# Altium project Relay-10A-Switching-Board-v2.0.PrjPcb (part 2 of 3)

## Sheet Controller-Sheet.SchDoc
size 420 x 297 mm; SheetNumber: 4; SheetTotal: 5
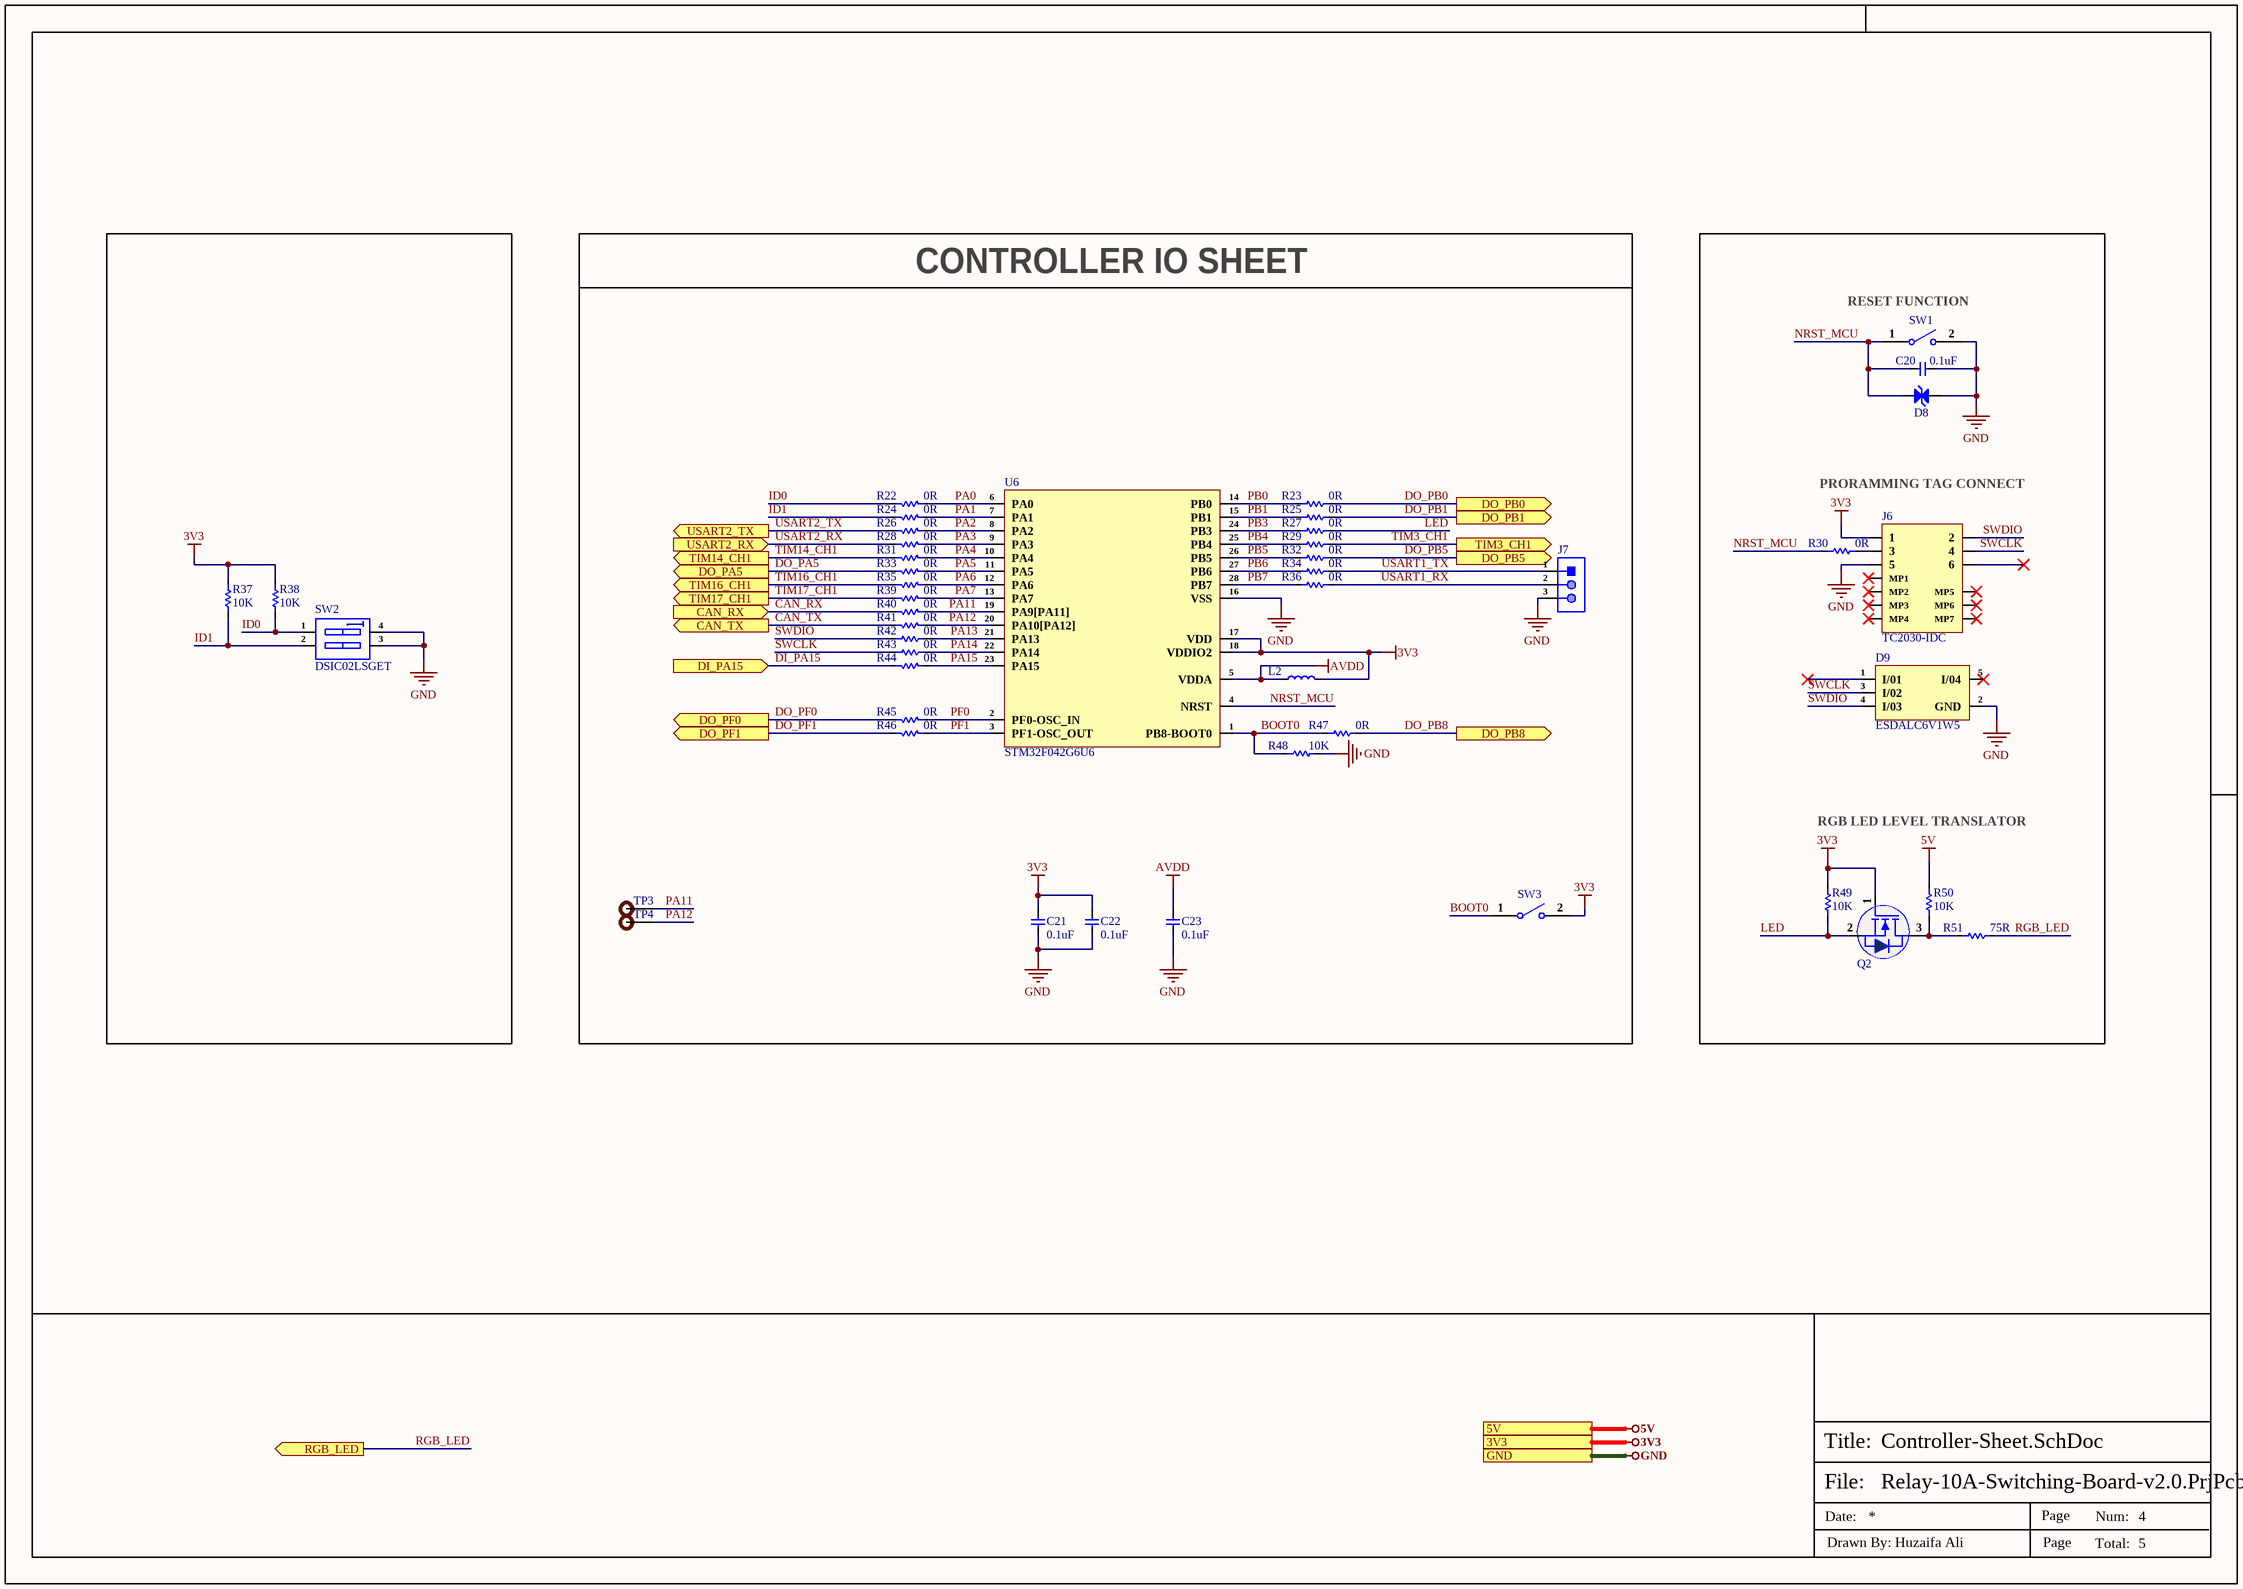
[diagram p2: Controller-Sheet.SchDoc]

### Parts
C20  0.1uF  [Cap-0402]
C21  0.1uF  [Cap-0402]
C22  0.1uF  [Cap-0402]
C23  0.1uF  [Cap-0402]
D8  ESDM2033MX4T5G  [DFN-2(0.3x0.6)]  (value not drawn)
D9  ESDALC6V1W5  [SOT-323-5]
J6  TC2030-IDC  [TC2030-IDC_]
J7  X6511WV-03H-C60D30  [HDR1X3_]  (value not drawn)
L2  BLM15AG601SN1D  [IND-0402]  (value not drawn)
Q2  Si2302CDS  [Sot-23]  (value not drawn)
R22  0R  [Res-0402]
R23  0R  [Res-0402]
R24  0R  [Res-0402]
R25  0R  [Res-0402]
R26  0R  [Res-0402]
R27  0R  [Res-0402]
R28  0R  [Res-0402]
R29  0R  [Res-0402]
R30  0R  [Res-0402]
R31  0R  [Res-0402]
R32  0R  [Res-0402]
R33  0R  [Res-0402]
R34  0R  [Res-0402]
R35  0R  [Res-0402]
R36  0R  [Res-0402]
R37  10K  [Res-0402]
R38  10K  [Res-0402]
R39  0R  [Res-0402]
R40  0R  [Res-0402]
R41  0R  [Res-0402]
R42  0R  [Res-0402]
R43  0R  [Res-0402]
R44  0R  [Res-0402]
R45  0R  [Res-0402]
R46  0R  [Res-0402]
R47  0R  [Res-0402]
R48  10K  [Res-0402]
R49  10K  [Res-0402]
R50  10K  [Res-0402]
R51  75R  [Res-0402]
SW1  B3U-1000P  [B3U-1000P]  (value not drawn)
SW2  DSIC02LSGET  [DSIC02LSGET]
SW3  B3U-1000P  [B3U-1000P]  (value not drawn)
TP3  TEST POINT  [Test-point]  (value not drawn)  (no BOM)
TP4  TEST POINT  [Test-point]  (value not drawn)  (no BOM)
U6  STM32F042G6U6  [28-UFQFPN (4x4)]

### Blocks framed on the sheet
CONTROLLER IO SHEET: C21-C23 J7 L2 R22-R29 R31-R36 R39-R48 SW3 TP3 TP4 U6

### Ports
3V3 (see Top-Sheet[3B], Comms-Sheet[4D], Power-Sheet[4D], Relay-10-Sheet[4D]), 5V (see Top-Sheet[3B], Comms-Sheet[4D], Power-Sheet[4D]), CAN_RX (in, see Top-Sheet[3B]), CAN_TX (out, see Top-Sheet[3B]), DI_PA15 (in, see Top-Sheet[4B]), DO_PA5 (out, see Top-Sheet[4B]), DO_PB0 (out, see Top-Sheet[4B]), DO_PB1 (out, see Top-Sheet[4B]), DO_PB5 (out, see Top-Sheet[4B]), DO_PB8 (out, see Top-Sheet[3B]), DO_PF0 (out, see Top-Sheet[3B]), DO_PF1 (out, see Top-Sheet[3B]), GND (see Top-Sheet[3B], Comms-Sheet[4D], Power-Sheet[4D], Relay-10-Sheet[4D]), RGB_LED (out, see Top-Sheet[3B]), TIM3_CH1 (out, see Top-Sheet[4B]), TIM14_CH1 (out, see Top-Sheet[4B]), TIM16_CH1 (out, see Top-Sheet[4B]), TIM17_CH1 (out, see Top-Sheet[4B]), USART2_RX (in, see Top-Sheet[3B]), USART2_TX (out, see Top-Sheet[3B])

### Nets
3V3: C21.1 C22.1 J6.1 L2.2 Q2.1(G) R37.2 R38.2 R49.2 SW3.2 U6.17(VDD) U6.18(VDDIO2) ; port 3V3
5V: R50.2 ; port 5V
AVDD: C23.1 L2.1 U6.5(VDDA)
GND: C20.1 C21.2 C22.2 C23.2 D8.1(A) D9.2(GND) J6.5 J7.3 R48.1 SW1.2 SW2.3(A3) SW2.4(B3) U6.16(VSS) ; port GND
BOOT0: R47.2 R48.2 SW3.1 U6.1(PB8-BOOT0)
CAN_RX: R40.1 ; port CAN_RX  [project net CAN1_RXD]
CAN_TX: R41.1 ; port CAN_TX  [project net CAN1_TXD]
DI_PA15: R44.1 ; port DI_PA15
DO_PA5: R33.1 ; port DO_PA5
DO_PB0: R23.1 ; port DO_PB0
DO_PB1: R25.1 ; port DO_PB1
DO_PB5: R32.1 ; port DO_PB5
DO_PB8: R47.1 ; port DO_PB8  [project net CAN1_SHDN]
DO_PF0: R45.1 ; port DO_PF0  [project net CAN1_STB]
DO_PF1: R46.1 ; port DO_PF1
ID0: R22.1 R38.1 SW2.1(A1)
ID1: R24.1 R37.1 SW2.2(A2)
LED: Q2.2(S) R27.1 R49.1
NRST_MCU: C20.2 D8.2(A) R30.2 SW1.1 U6.4(NRST)
PA0: R22.2 U6.6(PA0)
PA1: R24.2 U6.7(PA1)
PA2: R26.2 U6.8(PA2)
PA3: R28.2 U6.9(PA3)
PA4: R31.2 U6.10(PA4)
PA5: R33.2 U6.11(PA5)
PA6: R35.2 U6.12(PA6)
PA7: R39.2 U6.13(PA7)
PA11: R40.2 TP3.1 U6.19(PA9[PA11])
PA12: R41.2 TP4.1 U6.20(PA10[PA12])
PA13: R42.1 U6.21(PA13)
PA14: R43.1 U6.22(PA14)
PA15: R44.2 U6.23(PA15)
PB0: R23.2 U6.14(PB0)
PB1: R25.2 U6.15(PB1)
PB3: R27.2 U6.24(PB3)
PB4: R29.2 U6.25(PB4)
PB5: R32.2 U6.26(PB5)
PB6: R34.2 U6.27(PB6)
PB7: R36.2 U6.28(PB7)
PF0: R45.2 U6.2(PF0-OSC_IN)
PF1: R46.2 U6.3(PF1-OSC_OUT)
RGB_LED: R51.2 ; port RGB_LED  [project net LED1_DIN]
SWCLK: D9.3(I/02) J6.4 R43.2
SWDIO: D9.4(I/03) J6.2 R42.2
TIM3_CH1: R29.1 ; port TIM3_CH1
TIM14_CH1: R31.1 ; port TIM14_CH1
TIM16_CH1: R35.1 ; port TIM16_CH1
TIM17_CH1: R39.1 ; port TIM17_CH1
USART1_RX: J7.2 R36.1
USART1_TX: J7.1 R34.1
USART2_RX: R28.1 ; port USART2_RX  [project net 485_ROUT_1]
USART2_TX: R26.1 ; port USART2_TX  [project net 485_DIN_1]
NetJ6_3: J6.3 R30.1
NetQ2_3: Q2.3(D) R50.1 R51.1

Not connected (* = marked no-connect by the designer): D9 1(I/01)* 5(I/04)*; J6 6* MP1* MP2* MP3* MP4* MP5* MP6* MP7*

### Notes on the sheet
- (near SW1) RESET FUNCTION
- PRORAMMING TAG CONNECT
- RGB LED LEVEL TRANSLATOR
- File:
- Title:
- Date:
- Page
- Num:
- Total:
- Drawn By: Huzaifa Ali

### Library data of the parts
C20-C23 = CC0402JRX7R7BB104: CAP CER 0.1UF 16V X7R 0402; Manufacturer: Yageo; Material: 4241ConductorMaterial; Value: 100nF; Tolerance: 5%; Item Type: Capacitor; Supplier: Digikey; Supplier Part Number: 311-1676-1-ND; Manufacturer Part Number: CC0402JRX7R7BB104; RoHS: Yes; Category: Ceramic Capacitors; Stock: 1659111; Pricing: 1=0.1, 10=0.046, 50=0.0262, 100=0.0203, 500=0.01528, 1000=0.012, 2500=0.01091, 5000=0.01004 (USD); Mounting Technology: Surface Mount; Case/Package: 0402; Case Code (Metric): 1005; Case Code (Imperial): 0402; Min Operating Temperature: -55°C; Max Operating Temperature: 125°C; Dielectric: X7R; Packaging: Tape and Reel; Package Quantity: 10000; Voltage Rating (DC): 16V; Voltage Rating: 16V; Series: CC; Construction: Flat; Length: 0.039inch; Width: 0.02inch; Height: 0.5mm; Thickness: 0.022inch; Lead Free: Lead Free; Halogen Free: Halogen Free; RoHS Compliant: Yes; ComponentLink1URL: https://datasheet.ciiva.com/13210/upy-gphc-x7r-6-3v-to-50v-8-12304-13210152.pdf?src-supplier=Mouser; ComponentLink1Description: https://datasheet.ciiva.com/13210/upy-gphc-x7r-6-3v-to-50v-8-12304-13210152.pdf?src-supplier=Mouser; LCSC Part Number: C541464
D8 = ESDM2033MX4T5G: DIODE BIDIR ESD X4DFN2; Manufacturer: ON Semiconductor; Item Type: (TVS/ESD); Supplier: Avnet; LCSC Part Number: C896720; Manufacturer Part Number: ESDM2033MX4T5G; RoHS: Yes; Stock: 629400; Pricing: 8961=0.04129, 9000=0.04018, 18000=0.03906, 45000=0.03794, 90000=0.03683, 450000=0.03571, 900000=0.0346 (USD); Series: -
D9 = ESDALC6V1W5: TVS DIODE 3VWM SOT323-5; Manufacturer: STMicroelectronics; Item Type: TVS Diodes; Supplier: Future Electronics; LCSC Part Number: C703691; Manufacturer Part Number: ESDALC6V1W5; RoHS: Yes; Stock: 3000; Pricing: 3000=0.0569, 9000=0.0547, 12000=0.0774, 15000=0.0538, 30000=0.0749, 45000=0.0518, 75000=0.05 (USD); ComponentLink1URL: https://datasheet.ciiva.com/23847/cd00002946-23847220.pdf?src-supplier=Newark; ComponentLink1Description: https://datasheet.ciiva.com/23847/cd00002946-23847220.pdf?src-supplier=Newark; ComponentLink2URL: https://datasheet.ciiva.com/4509/cd00002946-81943-4509940.pdf?src-supplier=Mouser; ComponentLink2Description: https://datasheet.ciiva.com/4509/cd00002946-81943-4509940.pdf?src-supplier=Mouser; ComponentLink3URL: https://datasheet.ciiva.com/5782/cd00002946-5782886.pdf?src-supplier=Farnell; ComponentLink3Description: https://datasheet.ciiva.com/5782/cd00002946-5782886.pdf?src-supplier=Farnell; ComponentLink4URL: https://datasheet.ciiva.com/338/cd00002946-338376.pdf?src-supplier=Digikey; ComponentLink4Description: https://datasheet.ciiva.com/338/cd00002946-338376.pdf?src-supplier=Digikey; ComponentLink5URL: https://datasheet.ciiva.com/338/cd00002946-338377.pdf?src-supplier=Digikey; ComponentLink5Description: https://datasheet.ciiva.com/338/cd00002946-338377.pdf?src-supplier=Digikey; ComponentLink6URL: https://datasheet.ciiva.com/338/cd00002946-338378.pdf?src-supplier=Digikey; ComponentLink6Description: https://datasheet.ciiva.com/338/cd00002946-338378.pdf?src-supplier=Digikey
J6 = TC2030-IDC: CABLE ADAPTER 6 POS; Manufacturer: Tag-Connect; ComponentLink1URL: http://www.tag-connect.com/Materials/TC2030-MCP%20Datasheet.pdf?src-supplier=Digi-Key; ComponentLink1Description: http://www.tag-connect.com/Materials/TC2030-MCP%20Datasheet.pdf?src-supplier=Digi-Key; Supplier 1: Digi-Key; Manufacturer Part Number: TC2030-IDC; Stock 1: 284; Pricing 1: 1=43.71 (USD); Package Quantity: 1; Supplier Part Number 1: TC2030-IDC-ND
J7 = X6511WV-03H-C60D30: Gold 250V 3A Straight Square Pins 2.5mm 3P 260℃ 6mm -40℃~+105℃ 3mm 2.54mm Plugin Black Brass 1x3P Plugin,P=2.54mm Pin Headers ROHS; Manufacturer: XKB; Item Type: Male Header; Manufacturer Part Number: X6511WV-03H-C60D30; Package: Plugin,P=2.54mm; LCSC Part Number: C706875; ComponentLink1Description: LCSC; ComponentLink1URL: https://www.lcsc.com/product-detail/Pin-Headers_XKB-Connectivity-X6511WV-03H-C60D30_C706875.html
L2 = BLM15AG601SN1D: FERRITE BEAD 600 OHM 0402 1LN; Manufacturer: Murata; Material: Steel,Ferrite; Impedance: 600R; Tolerance: 25%; Max DC Current: 300mA; DC Resistance (DCR): 520mR; Test Frequency: 100MHz; Number of Lines: 1; Shielding: Unshielded; DC Resistance-Max: 600mR; Supplier 1: Digi-Key; Manufacturer Part Number: BLM15AG601SN1D; RoHS: Yes; Category: Inductors; Stock 1: 4108655; Pricing 1: 1=0.10000, 10=0.06500, 25=0.05760, 50=0.05240, 100=0.04710, 250=0.03456, 500=0.02514, 1000=0.02461, 5000=0.01676 (USD); Case/Package: 0402; Number of Pins: 2; Core Material: Ferrite; Case Code (Metric): 1005; Case Code (Imperial): 0402; Min Operating Temperature: -55°C; Max Operating Temperature: 125°C; Package Quantity: 10000; Packaging: Tape and Reel; Current Rating: 300mA; Max Current Rating: 300mA; Termination: SMD/SMT; DC Current: 300mA; Frequency: 100MHz; Number of Circuits: 1; Series: BLM15AG_SN; Length: 1mm; Width: 0.5mm; Height: 0.5mm; Depth: 0.55mm; Radiation Hardening: No; REACH SVHC: No SVHC; Military Standard: Not; Lead Free: Lead Free; RoHS Compliant: Yes; ComponentLink1URL: https://datasheet.ciiva.com/11799/0900766b811b5866-11799226.pdf?src-supplier=RSComponents; ComponentLink1Description: https://datasheet.ciiva.com/11799/0900766b811b5866-11799226.pdf?src-supplier=RSComponents; ComponentLink2URL: https://datasheet.ciiva.com/41449/001172163-da-01-en-drossel-0402-600r-1-0x0-5mm-10000st-41449450.pdf?src-supplier=Conrad; ComponentLink2Description: https://datasheet.ciiva.com/41449/001172163-da-01-en-drossel-0402-600r-1-0x0-5mm-10000st-41449450.pdf?src-supplier=Conrad; ComponentLink3URL: https://datasheet.ciiva.com/29347/442210-da-01-en-chip-drossel-0402-600r-300ma-1-0x0-5mm-29347879.pdf?src-supplier=Conrad; ComponentLink3Description: https://datasheet.ciiva.com/29347/442210-da-01-en-chip-drossel-0402-600r-300ma-1-0x0-5mm-29347879.pdf?src-supplier=Conrad; ComponentLink4URL: https://datasheet.ciiva.com/1466/5144-1466744.pdf?src-supplier=Element14; ComponentLink4Description: https://datasheet.ciiva.com/1466/5144-1466744.pdf?src-supplier=Element14; ComponentLink5URL: https://datasheet.ciiva.com/1466/5144-1466745.pdf?src-supplier=Element14; ComponentLink5Description: https://datasheet.ciiva.com/1466/5144-1466745.pdf?src-supplier=Element14; ComponentLink6URL: https://datasheet.ciiva.com/14122/blm-series-eng-tds-14122894.pdf?src-supplier=Distrelec; ComponentLink6Description: https://datasheet.ciiva.com/14122/blm-series-eng-tds-14122894.pdf?src-supplier=Distrelec; ComponentLink7URL: https://datasheet.ciiva.com/6212/l0110s0100blm15ag-sn-6212519.pdf?src-supplier=Digi-Key; ComponentLink7Description: https://datasheet.ciiva.com/6212/l0110s0100blm15ag-sn-6212519.pdf?src-supplier=Digi-Key; ComponentLink8URL: https://datasheet.ciiva.com/6212/l0110s0100blm15ag-sn-6212565.pdf?src-supplier=Digi-Key; ComponentLink8Description: https://datasheet.ciiva.com/6212/l0110s0100blm15ag-sn-6212565.pdf?src-supplier=Digi-Key; ComponentLink9URL: https://datasheet.ciiva.com/6212/l0110s0100blm15ag-sn-6212520.pdf?src-supplier=Digi-Key; ComponentLink9Description: https://datasheet.ciiva.com/6212/l0110s0100blm15ag-sn-6212520.pdf?src-supplier=Digi-Key; ComponentLink10URL: https://datasheet.ciiva.com/8084/l0110s0100blm15ag-sn-8084271.pdf?src-supplier=Avnet; ComponentLink10Description: https://datasheet.ciiva.com/8084/l0110s0100blm15ag-sn-8084271.pdf?src-supplier=Avnet; ComponentLink11URL: https://datasheet.ciiva.com/8510/l0110s0100blm15ag-sn-8510909.pdf?src-supplier=Avnet; ComponentLink11Description: https://datasheet.ciiva.com/8510/l0110s0100blm15ag-sn-8510909.pdf?src-supplier=Avnet; Supplier Part Number 1: 490-1006-1-ND; LCSC Part Number: C76884; Item Type: Ferrite Bead
Q2 = Si2302CDS: N-CHANNEL 20-V (D-S) MOSFET; Manufacturer: TECH PUBLIC; ComponentLink1Description: LCSC; ComponentLink1URL: https://www.lcsc.com/product-detail/MOSFETs_TECH-PUBLIC-SI2302CDS_C5310968.html; Manufacturer Part Number: SI2302CDS; Package: SOT-23; LCSC Part Number: C5310968; Item Type: Mosfet
R22-R36 R39-R47 = RC0402FR-070RL: RES 0 OHM JUMPER 1/16W 0402; Manufacturer: Yageo; Item Type: Resistors; Tolerance: 1%; Power Rating: 62.5mW; Voltage Rating: 50V; Temperature Coefficient: 200ppm/°C; Max Power Dissipation: 63mW; Supplier 1: Mouser; Manufacturer Part Number: RC0402FR-070RL; RoHS: Yes; Stock 1: 8556842; Pricing 1: 1=0.10000, 10=0.01400, 50=0.01400, 100=0.00600, 1000=0.00300, 5000=0.00200, 10000=0.00100 (USD); Mount: Surface Mount; Case/Package: 0402; Contact Plating: Tin,Matte; Case Code (Imperial): 0402; Case Code (Metric): 1005; Size Code: 0402; Min Operating Temperature: -55°C; Max Operating Temperature: 155°C; Resistance: 0R; Resistor Type: Thick Film; Packaging: Tape and Reel; Termination: SMD/SMT; Features: Moisture Resistant; Series: RC; Number of Terminations: 2; Length: 1mm; Width: 0.5mm; Height: 0.35mm; Radiation Hardening: No; Lead Free: Lead Free; RoHS Compliant: Yes; ComponentLink1URL: https://datasheet.ciiva.com/8896/pyu-rc0402-51-rohs-l-6-8896149.pdf?src-supplier=Avnet; ComponentLink1Description: https://datasheet.ciiva.com/8896/pyu-rc0402-51-rohs-l-6-8896149.pdf?src-supplier=Avnet; ComponentLink2URL: https://datasheet.ciiva.com/16790/pyu-rc0402-51-rohs-l-6-r-16790444.pdf?src-supplier=Future+Electronics; ComponentLink2Description: https://datasheet.ciiva.com/16790/pyu-rc0402-51-rohs-l-6-r-16790444.pdf?src-supplier=Future+Electronics; Supplier Part Number 1: 603-RC0402FR-070RL; LCSC Part Number: C106231
R37 R38 R48-R50 = RC0402FR-0710KL: RES 10K OHM 1% 1/16W 0402; Manufacturer: Yageo; Resistance: 10kR; Voltage Rating (DC): 50V; Temperature Coefficient: 100ppm/°C; Power Rating: 62.5mW; Max Power Dissipation: 63mW; Item Type: Resistor; Supplier 1: Mouser; Manufacturer Part Number: RC0402FR-0710KL; RoHS: Yes; Category: Chip SMD Resistors; Stock 1: 18648329; Pricing 1: 1=0.10000, 10=0.01400, 50=0.01400, 100=0.00500, 1000=0.00300, 10000=0.00200 (USD); Case/Package: 0402; Number of Pins: 2; Case Code (Imperial): 0402; Case Code (Metric): 1005; Min Operating Temperature: -55°C; Max Operating Temperature: 155°C; Resistor Type: Thick Film; Tolerance: 1%; Packaging: Tape and Reel; Voltage Rating: 50V; Termination: SMD/SMT; Working Voltage: 50V; Number of Terminations: 2; Features: Moisture Resistant; Series: RC; Resistance Tolerance: 1%; Construction: Rectangular; Length: 1mm; Width: 0.5mm; Height: 0.32mm; Depth: 0.5mm; Lead Pitch: 0.2mm; REACH SVHC: No SVHC; Lead Free: Lead Free; RoHS Compliant: Yes; Military Standard: Not; ComponentLink1URL: https://datasheet.ciiva.com/7660/38568-7660787.pdf?src-supplier=Element14; ComponentLink1Description: https://datasheet.ciiva.com/7660/38568-7660787.pdf?src-supplier=Element14; ComponentLink2URL: https://datasheet.ciiva.com/7849/1686128-7849814.pdf?src-supplier=Element14; ComponentLink2Description: https://datasheet.ciiva.com/7849/1686128-7849814.pdf?src-supplier=Element14; ComponentLink3URL: https://datasheet.ciiva.com/7983/1018594-7983486.pdf?src-supplier=Element14; ComponentLink3Description: https://datasheet.ciiva.com/7983/1018594-7983486.pdf?src-supplier=Element14; ComponentLink4URL: https://datasheet.ciiva.com/22747/1018594-22747512.pdf?src-supplier=Element14; ComponentLink4Description: https://datasheet.ciiva.com/22747/1018594-22747512.pdf?src-supplier=Element14; ComponentLink5URL: https://datasheet.ciiva.com/12667/pyu-rc0402-51-rohs-l-6-r-12667067.pdf?src-supplier=Mouser; ComponentLink5Description: https://datasheet.ciiva.com/12667/pyu-rc0402-51-rohs-l-6-r-12667067.pdf?src-supplier=Mouser; ComponentLink6URL: https://datasheet.ciiva.com/7849/1784430-7849813.pdf?src-supplier=Element14; ComponentLink6Description: https://datasheet.ciiva.com/7849/1784430-7849813.pdf?src-supplier=Element14; ComponentLink7URL: https://datasheet.ciiva.com/7849/1784430-7849815.pdf?src-supplier=Element14; ComponentLink7Description: https://datasheet.ciiva.com/7849/1784430-7849815.pdf?src-supplier=Element14; Supplier Part Number 1: 603-RC0402FR-0710KL; LCSC Part Number: C60490
R51 = RC0402JR-0775RL: RES 75 OHM 5% 1/16W 0402; Manufacturer: Yageo; Item Type: Resistor; Temperature Coefficient: 100ppm/°C; Power Rating: 62.5mW; Voltage Rating: 50V; Max Power Dissipation: 63mW; Supplier: Digikey; Supplier Part Number: 311-75JRCT-ND; Manufacturer Part Number: RC0402JR-0775RL; RoHS: Yes; Stock: 2993323; Pricing: 1=0.1, 10=0.018, 50=0.0102, 100=0.0083, 500=0.00528, 1000=0.00444, 5000=0.00307 (USD); Case/Package: 0402; Pins: 2; Contact Plating: Tin,Lead; Case Code (Imperial): 0402; Case Code (Metric): 1005; Min Operating Temperature: -55°C; Max Operating Temperature: 155°C; Value: 75R; Tolerance: 5%; Resistor Type: Thick Film; Packaging: Tape and Reel; Termination: SMD/SMT; Voltage Rating (DC): 50V; Features: Moisture Resistant; Series: RC; Number of Terminations: 2; Resistance Tolerance: 5%; Length: 1mm; Width: 0.5mm; Height: 0.35mm; Reach SVHC Compliant: No; Lead Free: Lead Free; RoHS Compliant: Yes; ComponentLink1URL: https://datasheet.ciiva.com/7983/1018594-7983612.pdf?src-supplier=Element14; ComponentLink1Description: https://datasheet.ciiva.com/7983/1018594-7983612.pdf?src-supplier=Element14; ComponentLink2URL: https://datasheet.ciiva.com/17082/pyu-rc0402-51-rohs-l-6-r-17082239.pdf?src-supplier=Future+Electronics; ComponentLink2Description: https://datasheet.ciiva.com/17082/pyu-rc0402-51-rohs-l-6-r-17082239.pdf?src-supplier=Future+Electronics; LCSC Part Number: C137841
SW1 SW3 = B3U-1000P: SWITCH TACTILE SPST-NO 0.05A 12V; Manufacturer: Omron; Mechanical Life: 200000Cycles; Operating Force: 1.5N; Throw Configuration: SPST; Current Rating: 50mA; Contact Resistance: 100mR; Illumination Type: Non-Illuminated,Illuminated; Switch Travel: 0.15mm; Switch Function: Off-Mom; Actuator Type: Standard; Actuator Length: 0.4mm; Ratings: Dust Proof,IP40; ComponentLink1URL: http://www.farnell.com/datasheets/60838.pdf?src-supplier=Farnell; ComponentLink1Description: http://www.farnell.com/datasheets/60838.pdf?src-supplier=Farnell; ComponentLink2URL: http://www.farnell.com/datasheets/60838.pdf?src-supplier=Element14; ComponentLink2Description: http://www.farnell.com/datasheets/60838.pdf?src-supplier=Element14; ComponentLink3URL: https://omronfs.omron.com/en_US/ecb/products/pdf/en-b3u.pdf?src-supplier=Digi-Key; ComponentLink3Description: https://omronfs.omron.com/en_US/ecb/products/pdf/en-b3u.pdf?src-supplier=Digi-Key; ComponentLink4URL: http://www.omron.com/ecb/products/pdf/en-b3u.pdf?src-supplier=Digi-Key; ComponentLink4Description: http://www.omron.com/ecb/products/pdf/en-b3u.pdf?src-supplier=Digi-Key; ComponentLink5URL: https://www.distrelec.biz/Web/Downloads/he/et/B3U_eng_datasheet.pdf?mime=application%2Fpdf&src-supplier=Distrelec; ComponentLink5Description: https://www.distrelec.biz/Web/Downloads/he/et/B3U_eng_datasheet.pdf?mime=application%2Fpdf&src-supplier=Distrelec; ComponentLink6URL: http://www.onlinecomponents.com/productFiles/mf-OM/en-b3u.pdf?src-supplier=Onlinecomponents.com; ComponentLink6Description: http://www.onlinecomponents.com/productFiles/mf-OM/en-b3u.pdf?src-supplier=Onlinecomponents.com; Supplier 1: Digi-Key; Manufacturer Part Number: B3U-1000P; Stock 1: 116454; Pricing 1: 1=1, 10=0.961, 25=0.9064, 50=0.7976, 100=0.7251, 250=0.68888, 500=0.67074, 1000=0.52571 (USD); Mount: Surface Mount; Weight: 0.000776oz; Contact Material: Silver; Min Operating Temperature: -25°C; Max Operating Temperature: 70°C; Packaging: Tape and Reel; Voltage Rating (DC): 12V; Package Quantity: 1; Max Current Rating: 50mA; Termination: SMD/SMT; Orientation: Straight; Max Voltage Rating (DC): 12V; Electrical Life: 200000Cycles; Insulation Resistance: 100MR; Contact Current Rating: 50mA; Length: 4mm; Height: 1.2mm; Depth: 2.5mm; Width: 3mm; REACH SVHC: Unknown; Lead Free: Lead Free; ComponentLink7URL: https://www.verical.com/server-webapp/html/getDatasheet?partID=552554&src-supplier=Verical; ComponentLink7Description: https://www.verical.com/server-webapp/html/getDatasheet?partID=552554&src-supplier=Verical; ComponentLink8URL: http://www.farnell.com/datasheets/1685550.pdf?src-supplier=Element14; ComponentLink8Description: http://www.farnell.com/datasheets/1685550.pdf?src-supplier=Element14; ComponentLink9URL: http://www.farnell.com/datasheets/2610940.pdf?src-supplier=Farnell; ComponentLink9Description: http://www.farnell.com/datasheets/2610940.pdf?src-supplier=Farnell; ComponentLink10URL: https://www.alliedelec.com/m/d/4c8a9ef82804fc3c241a13c1e298fd73.pdf?src-supplier=Allied+Electronics; ComponentLink10Description: https://www.alliedelec.com/m/d/4c8a9ef82804fc3c241a13c1e298fd73.pdf?src-supplier=Allied+Electronics; Supplier Part Number 1: SW1020DKR-ND; LCSC Part Number: C231329; Item Type: Switch
SW2 = DSIC02LSGET: 2 positions SPST Black Flat Toggle, Raised Style SMD-4P,5.1x6mm DIP Switches ROHS; Manufacturer: DongGuan; Item Type: Switch; Manufacturer Part Number: DSIC02LSGET; Package: SMD-4P,5.1x6mm; LCSC Part Number: C54949; ComponentLink1Description: LCSC; ComponentLink1URL: https://www.lcsc.com/product-detail/DIP-Switches_DongGuan-KINGTEK-Industrial-Co-LTD-DSIC02LSGET_C54949.html?s_z=n_DSIC02LSGET
TP3 TP4 = TEST POINT: Test Point ON; Item Type: TEST POINT
U6 = STM32F042G6U6: IC MCU 32BIT 32KB FLASH 28UFQFPN; Manufacturer: STMicroelectronics; RAM Size: 6KB; Interface: I2C,SPI,USB,CAN,USART,HDMI,IrDA,UART,LIN,I2S; Number of I/Os: 24; Number of Timers/Counters: 6; Oscillator Type: Internal; Min Supply Voltage: 2V; Max Supply Voltage: 3.6V; Data Bus Width: 32b; Number of ADC Channels: 13; Peripherals: POR,PWM,WDT,DMA; Core Architecture: ARM; Nominal Supply Current: 1.7uA; Number of A/D Converters: 1NUMBER; Number of Channels: 10NUMBER; Number of PWM Channels: 6NUMBER; Number of UART Channels: 2NUMBER; Max Power Dissipation: 170mW; Frequency: 48MHz; Watchdog Timer: Yes; Supplier: Mouser; LCSC Part Number: C961597; Manufacturer Part Number: STM32F042G6U6; RoHS: Yes; Item Type: IC; Stock: 43229; Pricing: 1=2.78, 10=1.83, 50=1.83, 100=1.72, 1000=1.56, 10000=1.5 (USD); Case/Package: UFQFPN; Pins: 28; Min Operating Temperature: -40°C; Max Operating Temperature: 85°C; Packaging: Tray; Series: STM32 F0; Memory Format: FLASH; Memory Size: 32KB; Package Quantity: 2940; Number of I2C Channels: 1NUMBER; Number of SPI Channels: 1NUMBER; Number of USB Channels: 1NUMBER; Number of Programmable I/O: 24; Clock Frequency: 48MHz; Height: 600um; Radiation Hardening: No; RoHS Compliant: Yes; Reach SVHC Compliant: No; Lead Free: Lead Free; ComponentLink1URL: https://datasheet.ciiva.com/48494/dm00105814-48494126.pdf?src-supplier=Avnet; ComponentLink1Description: https://datasheet.ciiva.com/48494/dm00105814-48494126.pdf?src-supplier=Avnet

## Sheet Relay-10-Sheet.SchDoc
size 420 x 297 mm; SheetNumber: 5; SheetTotal: 5
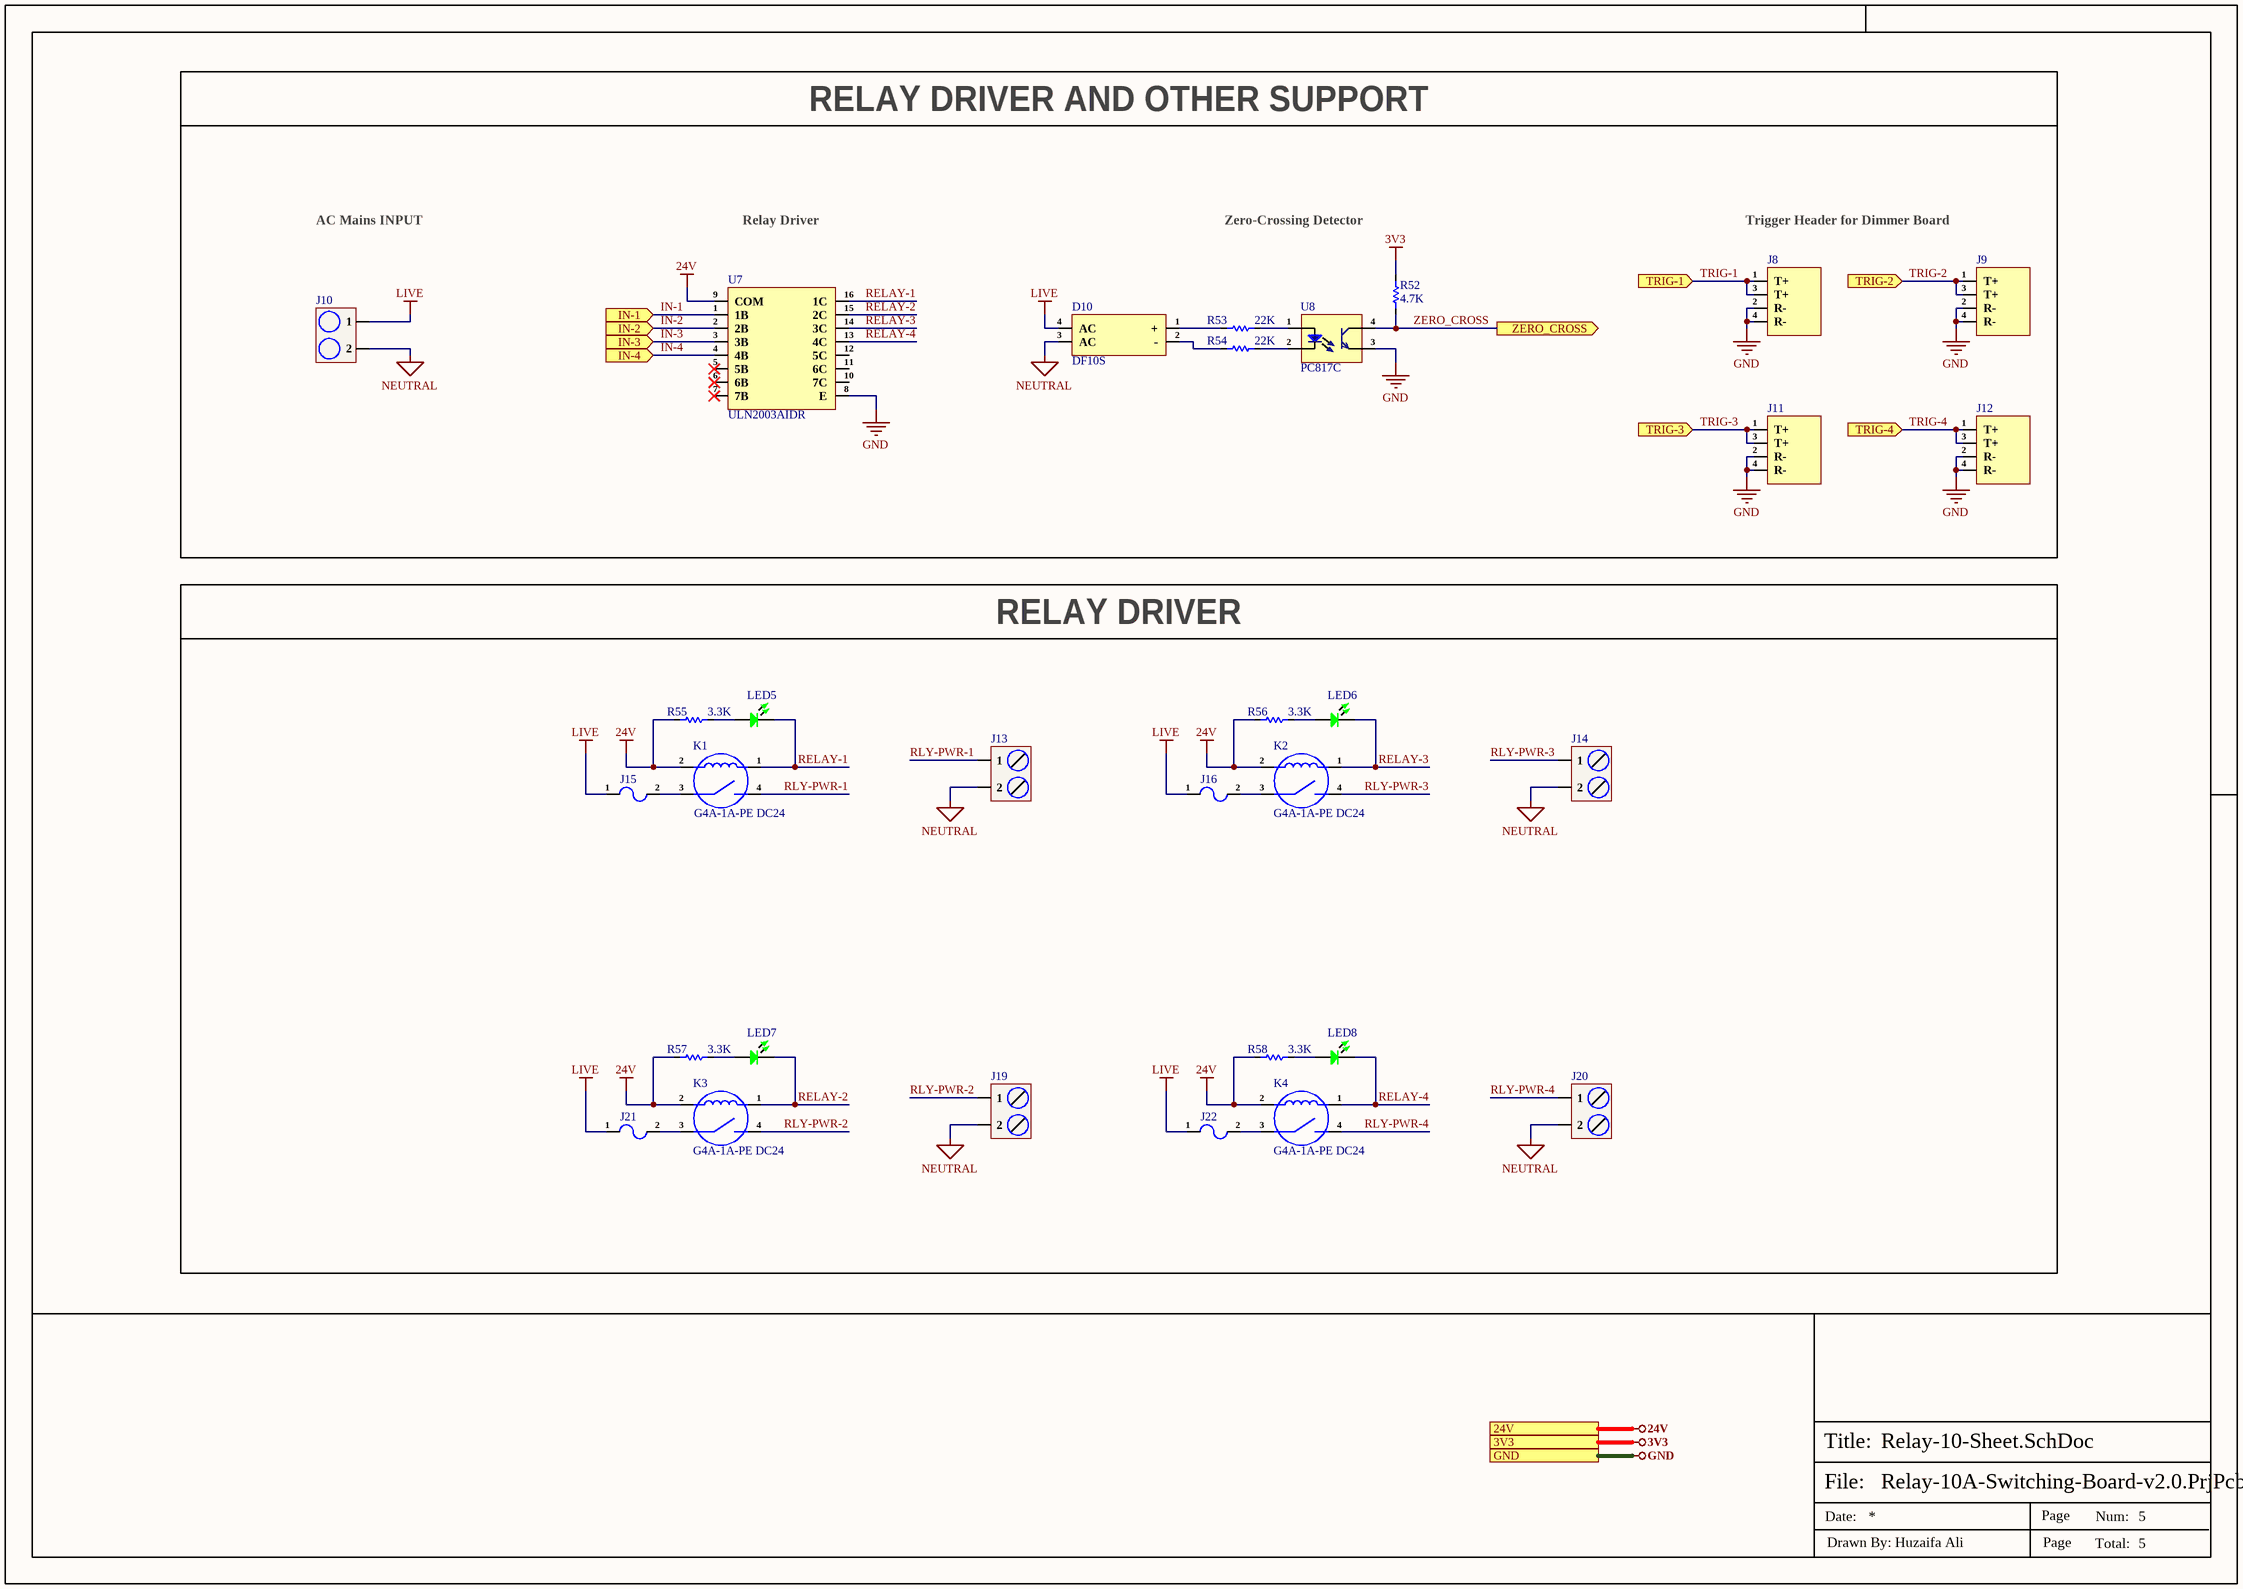
[diagram p3: Relay-10-Sheet.SchDoc]

### Parts
D10  DF10S  [DF10S]
J8  R-RJ11R04P-A802  [R-RJ11R04P-A802]  (value not drawn)
J9  R-RJ11R04P-A802  [R-RJ11R04P-A802]  (value not drawn)
J10  KF88SA-16.0-2P  [KF88SA-16.0-2P]  (value not drawn)
J11  R-RJ11R04P-A802  [R-RJ11R04P-A802]  (value not drawn)
J12  R-RJ11R04P-A802  [R-RJ11R04P-A802]  (value not drawn)
J13  DBT50G-7.62-2P-BK-P  [DBT50G-7.62-2P-BK-P]  (value not drawn)
J14  DBT50G-7.62-2P-BK-P  [DBT50G-7.62-2P-BK-P]  (value not drawn)
J15  03540101ZXGY  [03540101ZXGY]  (value not drawn)
J16  03540101ZXGY  [03540101ZXGY]  (value not drawn)
J19  DBT50G-7.62-2P-BK-P  [DBT50G-7.62-2P-BK-P]  (value not drawn)
J20  DBT50G-7.62-2P-BK-P  [DBT50G-7.62-2P-BK-P]  (value not drawn)
J21  03540101ZXGY  [03540101ZXGY]  (value not drawn)
J22  03540101ZXGY  [03540101ZXGY]  (value not drawn)
K1  G4A-1A-PE DC24  [G4A-1A-PE DC24]
K2  G4A-1A-PE DC24  [G4A-1A-PE DC24]
K3  G4A-1A-PE DC24  [G4A-1A-PE DC24]
K4  G4A-1A-PE DC24  [G4A-1A-PE DC24]
LED5  NFD5408UGD  [TH LED 5mm Green]  (value not drawn)
LED6  NFD5408UGD  [TH LED 5mm Green]  (value not drawn)
LED7  NFD5408UGD  [TH LED 5mm Green]  (value not drawn)
LED8  NFD5408UGD  [TH LED 5mm Green]  (value not drawn)
R52  4.7K  [Res-0402]
R53  22K  [RES-2512]
R54  22K  [RES-2512]
R55  3.3K  [Res-0402]
R56  3.3K  [Res-0402]
R57  3.3K  [Res-0402]
R58  3.3K  [Res-0402]
U7  ULN2003AIDR  [16-SOIC (0.154", 3.90mm Width)]
U8  PC817C  [PC817C]

### Blocks framed on the sheet
RELAY DRIVER AND OTHER SUPPORT: D10 J8-J12 R52-R54 U7 U8
RELAY DRIVER: J13-J16 J19-J22 K1-K4 LED5-LED8 R55-R58

### Ports
3V3 (see Top-Sheet[5B], Comms-Sheet[4D], Controller-Sheet[4D], Power-Sheet[4D]), 24V (see Top-Sheet[5B], Power-Sheet[4D]), GND (see Top-Sheet[5B], Comms-Sheet[4D], Controller-Sheet[4D], Power-Sheet[4D]), IN-1 (in, see Top-Sheet[5B]), IN-2 (in, see Top-Sheet[5B]), IN-3 (in, see Top-Sheet[5B]), IN-4 (in, see Top-Sheet[5B]), TRIG-1 (in, see Top-Sheet[5B]), TRIG-2 (in, see Top-Sheet[5B]), TRIG-3 (in, see Top-Sheet[5B]), TRIG-4 (in, see Top-Sheet[5B]), ZERO_CROSS (out, see Top-Sheet[5B])

### Nets
3V3: R52.2 ; port 3V3
24V: K1.2 K2.2 K3.2 K4.2 R55.1 R56.1 R57.1 R58.1 U7.9(COM) ; port 24V
GND: J8.2(R-) J8.4(R-) J9.2(R-) J9.4(R-) J11.2(R-) J11.4(R-) J12.2(R-) J12.4(R-) U7.8(E) U8.3(E) ; port GND
LIVE: D10.4(AC) J10.1 J15.1 J16.1 J21.1 J22.1
NEUTRAL: D10.3(AC) J10.2 J13.2 J14.2 J19.2 J20.2
IN-1: U7.1(1B) ; port IN-1  [project net DO_PA5]
IN-2: U7.2(2B) ; port IN-2  [project net DO_PB0]
IN-3: U7.3(3B) ; port IN-3  [project net DO_PB1]
IN-4: U7.4(4B) ; port IN-4  [project net DO_PB5]
RELAY-1: K1.1 LED5.1 U7.16(1C)
RELAY-2: K3.1 LED7.1 U7.15(2C)
RELAY-3: K2.1 LED6.1 U7.14(3C)
RELAY-4: K4.1 LED8.1 U7.13(4C)
RLY-PWR-1: J13.1 K1.4
RLY-PWR-2: J19.1 K3.4
RLY-PWR-3: J14.1 K2.4
RLY-PWR-4: J20.1 K4.4
TRIG-1: J8.1(T+) J8.3(T+) ; port TRIG-1  [project net TIM3_CH1]
TRIG-2: J9.1(T+) J9.3(T+) ; port TRIG-2  [project net TIM14_CH1]
TRIG-3: J11.1(T+) J11.3(T+) ; port TRIG-3  [project net TIM16_CH1]
TRIG-4: J12.1(T+) J12.3(T+) ; port TRIG-4  [project net TIM17_CH1]
ZERO_CROSS: R52.1 U8.4(C) ; port ZERO_CROSS  [project net DI_PA15]
NetD10_1: D10.1(+) R53.1
NetD10_2: D10.2(-) R54.1
NetJ15_2: J15.2 K1.3
NetJ16_2: J16.2 K2.3
NetJ21_2: J21.2 K3.3
NetJ22_2: J22.2 K4.3
NetLED5_2: LED5.2 R55.2
NetLED6_2: LED6.2 R56.2
NetLED7_2: LED7.2 R57.2
NetLED8_2: LED8.2 R58.2
NetR53_2: R53.2 U8.1(An)
NetR54_2: R54.2 U8.2(Ca)

Not connected (* = marked no-connect by the designer): U7 5(5B)* 6(6B)* 7(7B)* 10(7C) 11(6C) 12(5C)

### Notes on the sheet
- AC Mains INPUT
- Relay Driver
- Zero-Crossing Detector
- Trigger Header for Dimmer Board
- File:
- Title:
- Date:
- Page
- Num:
- Total:
- Drawn By: Huzaifa Ali

### Library data of the parts
D10 = DF10S: 50A 1.1V@1A 1A 1kV DBS Bridge Rectifiers ROHS; Manufacturer: MSKSEMI; Manufacturer Part Number: DF10S; Package: DBS; LCSC Part Number: C5174636; Item Type: Bridge Rectifier; ComponentLink1Description: LCSC; ComponentLink1URL: https://www.lcsc.com/product-detail/Bridge-Rectifiers_MSKSEMI-DF10S_C5174636.html
J8 J9 J11 J12 = R-RJ11R04P-A802: RJ11Receptacle 1 Plugin Ethernet Connectors / Modular Connectors (RJ45 RJ11) ROHS; Manufacturer: Ckmtw(Shenzhen Cankemeng); Manufacturer Part Number: R-RJ11R04P-A802; Package: Plugin; LCSC Part Number: C189737; Item Type: (RJ45 RJ11); ComponentLink1Description: LCSC; ComponentLink1URL: https://www.lcsc.com/product-detail/Ethernet-Connectors-Modular-Connectors-RJ45-RJ11_Ckmtw-Shenzhen-Cankemeng-R-RJ11R04P-A802_C189737.html
J10 = KF88SA-16.0-2P: 1x2P Barrier Block 2 1 16mm -40℃~+105℃ 76A 1kV Black 6~14 Straight pin 16 Plugin,P=16mm Barrier Terminal Blocks ROHS; Manufacturer: CiXi KaiFeng Electronics; Supplier: LCSC; LCSC Part Number: C707749; Manufacturer Part Number: KF88SA-16.0-2P; RoHS: No; Item Type: Terminal Block; ComponentLink1Description: LCSC; ComponentLink1URL: https://www.lcsc.com/product-detail/Barrier-Terminal-Blocks_Cixi-Kefa-Elec-KF88SA-16-0-2P_C707749.html
J13 J14 J19 J20 = DBT50G-7.62-2P-BK-P: 1x2P Corner With Cover Plate 2 1 7.62mm -40℃~+105℃ 20A 300V Black 12~22 Straight Needle Plugin,P=7.62mm Barrier Terminal Blocks ROHS; Manufacturer: DORABO; Manufacturer Part Number: DBT50G-7.62-2P-BK-P; Package: Plugin,P=7.62mm; LCSC Part Number: C496127; Item Type: Terminal Block; ComponentLink1Description: LCSC; ComponentLink1URL: https://www.lcsc.com/product-detail/Barrier-Terminal-Blocks_DORABO-DBT50G-7-62-2P-BK-P_C496127.html
J15 J16 J21 J22 = 03540101ZXGY: FUSE BLOCK CART 600V 15A PCB; Manufacturer: Littelfuse; Body Material: Bronze,Tin; Voltage Rating: 300V; Number of Poles: 1; Fuse Size: 0.25 Dia x 1.26 L (6.35mm x 32mm); Supplier: Rs; Supplier Part Number: 1740648; Manufacturer Part Number: 03540101ZXGY; RoHS: Yes; Category: Fuse Holders; Stock: 169; Mounting Technology: Through Hole; Case/Package: 300; Contact Material: Bronze; Contact Plating: Tin; Material: Thermoplastic; Color: Grey; Min Operating Temperature: -40°C; Max Operating Temperature: 85°C; Current Rating: 15A; Package Quantity: 50; Packaging: Bulk; Voltage Rating (DC): 300V; Voltage Rating (AC): 300V; Number of Circuits: 1; Voltage: 600V; Termination: PC Pin; Fuse Current: 15A; Orientation: Horizontal; Series: OMNI-BLOK® 354; Length: 12.7mm; Width: 12.7mm; Depth: 35.56mm; Reach SVHC Compliant: No; Lead Free: Lead Free; Flammability Rating: UL94 V-0; ComponentLink1URL: https://datasheet.ciiva.com/15187/getdatasheetpartid-114928-15187899.pdf?src-supplier=Verical; ComponentLink1Description: https://datasheet.ciiva.com/15187/getdatasheetpartid-114928-15187899.pdf?src-supplier=Verical; ComponentLink2URL: https://datasheet.ciiva.com/16208/354-omniblok-16208437.pdf?src-supplier=Future+Electronics; ComponentLink2Description: https://datasheet.ciiva.com/16208/354-omniblok-16208437.pdf?src-supplier=Future+Electronics; ComponentLink3URL: https://datasheet.ciiva.com/1269/354-omniblok-1269606.pdf?src-supplier=Element14; ComponentLink3Description: https://datasheet.ciiva.com/1269/354-omniblok-1269606.pdf?src-supplier=Element14
K1-K4 = G4A-1A-PE DC24: RELAY GEN PURPOSE SPST 20A 24V; Manufacturer: Omron; Supplier: Arrow Electronics; LCSC Part Number: C231366; Manufacturer Part Number: G4A-1A-PE DC24; RoHS: Yes; Item Type: Relay; Stock: 435; Pricing: 20=4.964, 50=4.555, 100=4.412 (USD); ComponentLink1URL: https://omronfs.omron.com/en_US/ecb/products/pdf/en-g4a.pdf?src-supplier=Digikey; ComponentLink1Description: https://omronfs.omron.com/en_US/ecb/products/pdf/en-g4a.pdf?src-supplier=Digikey; ComponentLink2URL: https://datasheet.octopart.com/G4A-1A-PE-DC24-Omron-datasheet-8474777.pdf?src-supplier=Newark; ComponentLink2Description: https://datasheet.octopart.com/G4A-1A-PE-DC24-Omron-datasheet-8474777.pdf?src-supplier=Newark; ComponentLink3URL: https://datasheet.octopart.com/G4A-1A-PE-DC24-Omron-datasheet-151868987.pdf?src-supplier=Master+Electronics; ComponentLink3Description: https://datasheet.octopart.com/G4A-1A-PE-DC24-Omron-datasheet-151868987.pdf?src-supplier=Master+Electronics
LED5-LED8 = NFD5408UGD: 515nm~525nm -30℃~+85℃ Emerald 30° 200mW Plugin,D=5mm LED Indication - Discrete ROHS; Manufacturer: Foshan; Manufacturer Part Number: NFD5408UGD; Package: Plugin,D=5mm; LCSC Part Number: C20618157; Item Type: LED; ComponentLink1Description: LCSC; ComponentLink1URL: https://www.lcsc.com/product-detail/LED-Indication-Discrete_Foshan-NationStar-Optoelectronics-NFD5408UGD_C20618157.html
R52 = RC0402FR-074K7L: RES 4.7K OHM 1% 1/16W 0402; Manufacturer: Yageo; Voltage Rating (DC): 50V; Power Rating: 62.5mW; Resistance: 4.7kR; Temperature Coefficient: 100ppm/°C; Max Power Dissipation: 63mW; Item Type: Resistor; Supplier 1: Avnet; Manufacturer Part Number: RC0402FR-074K7L; RoHS: Yes; Category: Chip SMD Resistors; Stock 1: 2420000; Pricing 1: 10000=0.00085 (USD); Case/Package: 0402; Number of Pins: 2; Case Code (Imperial): 0402; Case Code (Metric): 1005; Size Code: 0402; Min Operating Temperature: -55°C; Max Operating Temperature: 155°C; Tolerance: 1%; Voltage Rating: 50V; Packaging: Tape and Reel; Resistor Type: Thick Film; Termination: SMD/SMT; Features: Moisture Resistant; Series: RC; Number of Terminations: 2; Resistance Tolerance: 1%; Construction: Rectangular; Length: 1mm; Width: 0.5mm; Height: 0.32mm; Depth: 0.5mm; Height - Seated (Max): 0.016inch; RoHS Compliant: Yes; Reach SVHC Compliant: Yes; Military Standard: Not; Lead Free: Lead Free; ComponentLink1URL: https://datasheet.ciiva.com/22661/1686128-22661342.pdf?src-supplier=Element14; ComponentLink1Description: https://datasheet.ciiva.com/22661/1686128-22661342.pdf?src-supplier=Element14; ComponentLink2URL: https://datasheet.ciiva.com/7850/1018594-7850022.pdf?src-supplier=Element14; ComponentLink2Description: https://datasheet.ciiva.com/7850/1018594-7850022.pdf?src-supplier=Element14; ComponentLink3URL: https://datasheet.ciiva.com/7850/1018594-7850023.pdf?src-supplier=Element14; ComponentLink3Description: https://datasheet.ciiva.com/7850/1018594-7850023.pdf?src-supplier=Element14; ComponentLink4URL: https://datasheet.ciiva.com/15215/getdatasheetpartid-328119-15215035.pdf?src-supplier=Verical; ComponentLink4Description: https://datasheet.ciiva.com/15215/getdatasheetpartid-328119-15215035.pdf?src-supplier=Verical; Supplier Part Number 1: RC0402FR-074K7L; LCSC Part Number: C105871
R53 R54 = WR25X223JTL: 1W 250V ±100ppm/℃ ±5% 22kΩ 2512 Chip Resistor - Surface Mount ROHS; Manufacturer: Walsin Tech Corp; Manufacturer Part Number: WR25X223JTL; Package: 2512; LCSC Part Number: C396242; Item Type: Resistor; ComponentLink1Description: LCSC; ComponentLink1URL: https://www.lcsc.com/product-detail/Chip-Resistor-Surface-Mount_Walsin-Tech-Corp-WR25X223JTL_C396242.html
R55-R58 = RC0402FR-073K3L: RES 3.3K OHM 1% 1/16W 0402; Manufacturer: Yageo; Resistance: 3.3kR; Power Rating: 62.5mW; Voltage Rating: 50V; Temperature Coefficient: 100ppm/°C; Max Power Dissipation: 63mW; Item Type: Resistor; Supplier 1: Mouser; Manufacturer Part Number: RC0402FR-073K3L; RoHS: Yes; Category: Chip SMD Resistors; Stock 1: 2413047; Pricing 1: 1=0.10000, 10=0.01400, 50=0.01400, 100=0.00600, 1000=0.00300, 5000=0.00200, 10000=0.00100 (USD); Case/Package: 0402; Number of Pins: 2; Case Code (Imperial): 0402; Case Code (Metric): 1005; Size Code: 0402; Min Operating Temperature: -55°C; Max Operating Temperature: 155°C; Tolerance: 1%; Voltage Rating (DC): 50V; Packaging: Tape and Reel; Package Quantity: 1; Termination: SMD/SMT; Resistor Type: Thick Film; Number of Terminations: 2; Features: Moisture Resistant; Series: RC; Resistance Tolerance: 1%; Technology: THICK FILM; Construction: Rectangular; Length: 1mm; Width: 0.5mm; Height: 0.016inch; Depth: 0.5mm; RoHS Compliant: Yes; REACH SVHC: No SVHC; Military Standard: Not; Lead Free: Lead Free; ComponentLink1URL: https://datasheet.ciiva.com/11808/0900766b80c66297-11808441.pdf?src-supplier=RSComponents; ComponentLink1Description: https://datasheet.ciiva.com/11808/0900766b80c66297-11808441.pdf?src-supplier=RSComponents; ComponentLink2URL: https://datasheet.ciiva.com/46394/1018594-46394940.pdf?src-supplier=Element14; ComponentLink2Description: https://datasheet.ciiva.com/46394/1018594-46394940.pdf?src-supplier=Element14; ComponentLink3URL: https://datasheet.ciiva.com/2453/pyu-r-int-thick-7-2453395.pdf?src-supplier=Digi-Key; ComponentLink3Description: https://datasheet.ciiva.com/2453/pyu-r-int-thick-7-2453395.pdf?src-supplier=Digi-Key; ComponentLink4URL: https://datasheet.ciiva.com/2453/pyu-r-int-thick-7-2453396.pdf?src-supplier=Digi-Key; ComponentLink4Description: https://datasheet.ciiva.com/2453/pyu-r-int-thick-7-2453396.pdf?src-supplier=Digi-Key; ComponentLink5URL: https://datasheet.ciiva.com/2453/pyu-r-int-thick-7-2453394.pdf?src-supplier=Digi-Key; ComponentLink5Description: https://datasheet.ciiva.com/2453/pyu-r-int-thick-7-2453394.pdf?src-supplier=Digi-Key; ComponentLink6URL: https://datasheet.ciiva.com/16746/pyu-rc0402-51-rohs-l-6-r-16746361.pdf?src-supplier=Future+Electronics; ComponentLink6Description: https://datasheet.ciiva.com/16746/pyu-rc0402-51-rohs-l-6-r-16746361.pdf?src-supplier=Future+Electronics; Supplier Part Number 1: 603-RC0402FR-073K3L; LCSC Part Number: C137992
U7 = ULN2003AIDR: IC PWR RELAY 7NPN 1:1 16SOIC; Manufacturer: Texas Instruments; Supplier: Mouser; Supplier Part Number: 595-ULN2003AIDR; Manufacturer Part Number: ULN2003AIDR; RoHS: Yes; Item Type: IC; Stock: 2012; Pricing: 1=0.66, 10=0.589, 50=0.589, 100=0.402, 1000=0.285, 10000=0.232 (USD); ComponentLink1URL: https://datasheet.ciiva.com/15139/getdatasheetpartid-47948-15139878.pdf?src-supplier=Verical; ComponentLink1Description: https://datasheet.ciiva.com/15139/getdatasheetpartid-47948-15139878.pdf?src-supplier=Verical; ComponentLink2URL: https://datasheet.ciiva.com/14424/ulq2003a-14424030.pdf?src-supplier=Avnet; ComponentLink2Description: https://datasheet.ciiva.com/14424/ulq2003a-14424030.pdf?src-supplier=Avnet; ComponentLink3URL: https://datasheet.ciiva.com/1700/uln2003ai-1700820.pdf?src-supplier=Digikey; ComponentLink3Description: https://datasheet.ciiva.com/1700/uln2003ai-1700820.pdf?src-supplier=Digikey; ComponentLink4URL: https://datasheet.ciiva.com/1700/uln2003ai-1700821.pdf?src-supplier=Digikey; ComponentLink4Description: https://datasheet.ciiva.com/1700/uln2003ai-1700821.pdf?src-supplier=Digikey; ComponentLink5URL: https://datasheet.ciiva.com/1700/uln2003ai-1700822.pdf?src-supplier=Digikey; ComponentLink5Description: https://datasheet.ciiva.com/1700/uln2003ai-1700822.pdf?src-supplier=Digikey
U8 = PC817C: 70V 5kV 50mA 100mV@1mA,20mA 1 6V 1.2V DC SMD-4 Transistor Output Optocoupler ROHS; Manufacturer: Slkor; Item Type: IC; Manufacturer Part Number: PC817C; Package: SMD-4; LCSC Part Number: C2936043; ComponentLink1Description: LCSC; ComponentLink1URL: https://www.lcsc.com/product-detail/Transistor-Output-Optocoupler_Slkor-SLKORMICRO-Elec-PC817C_C2936043.html